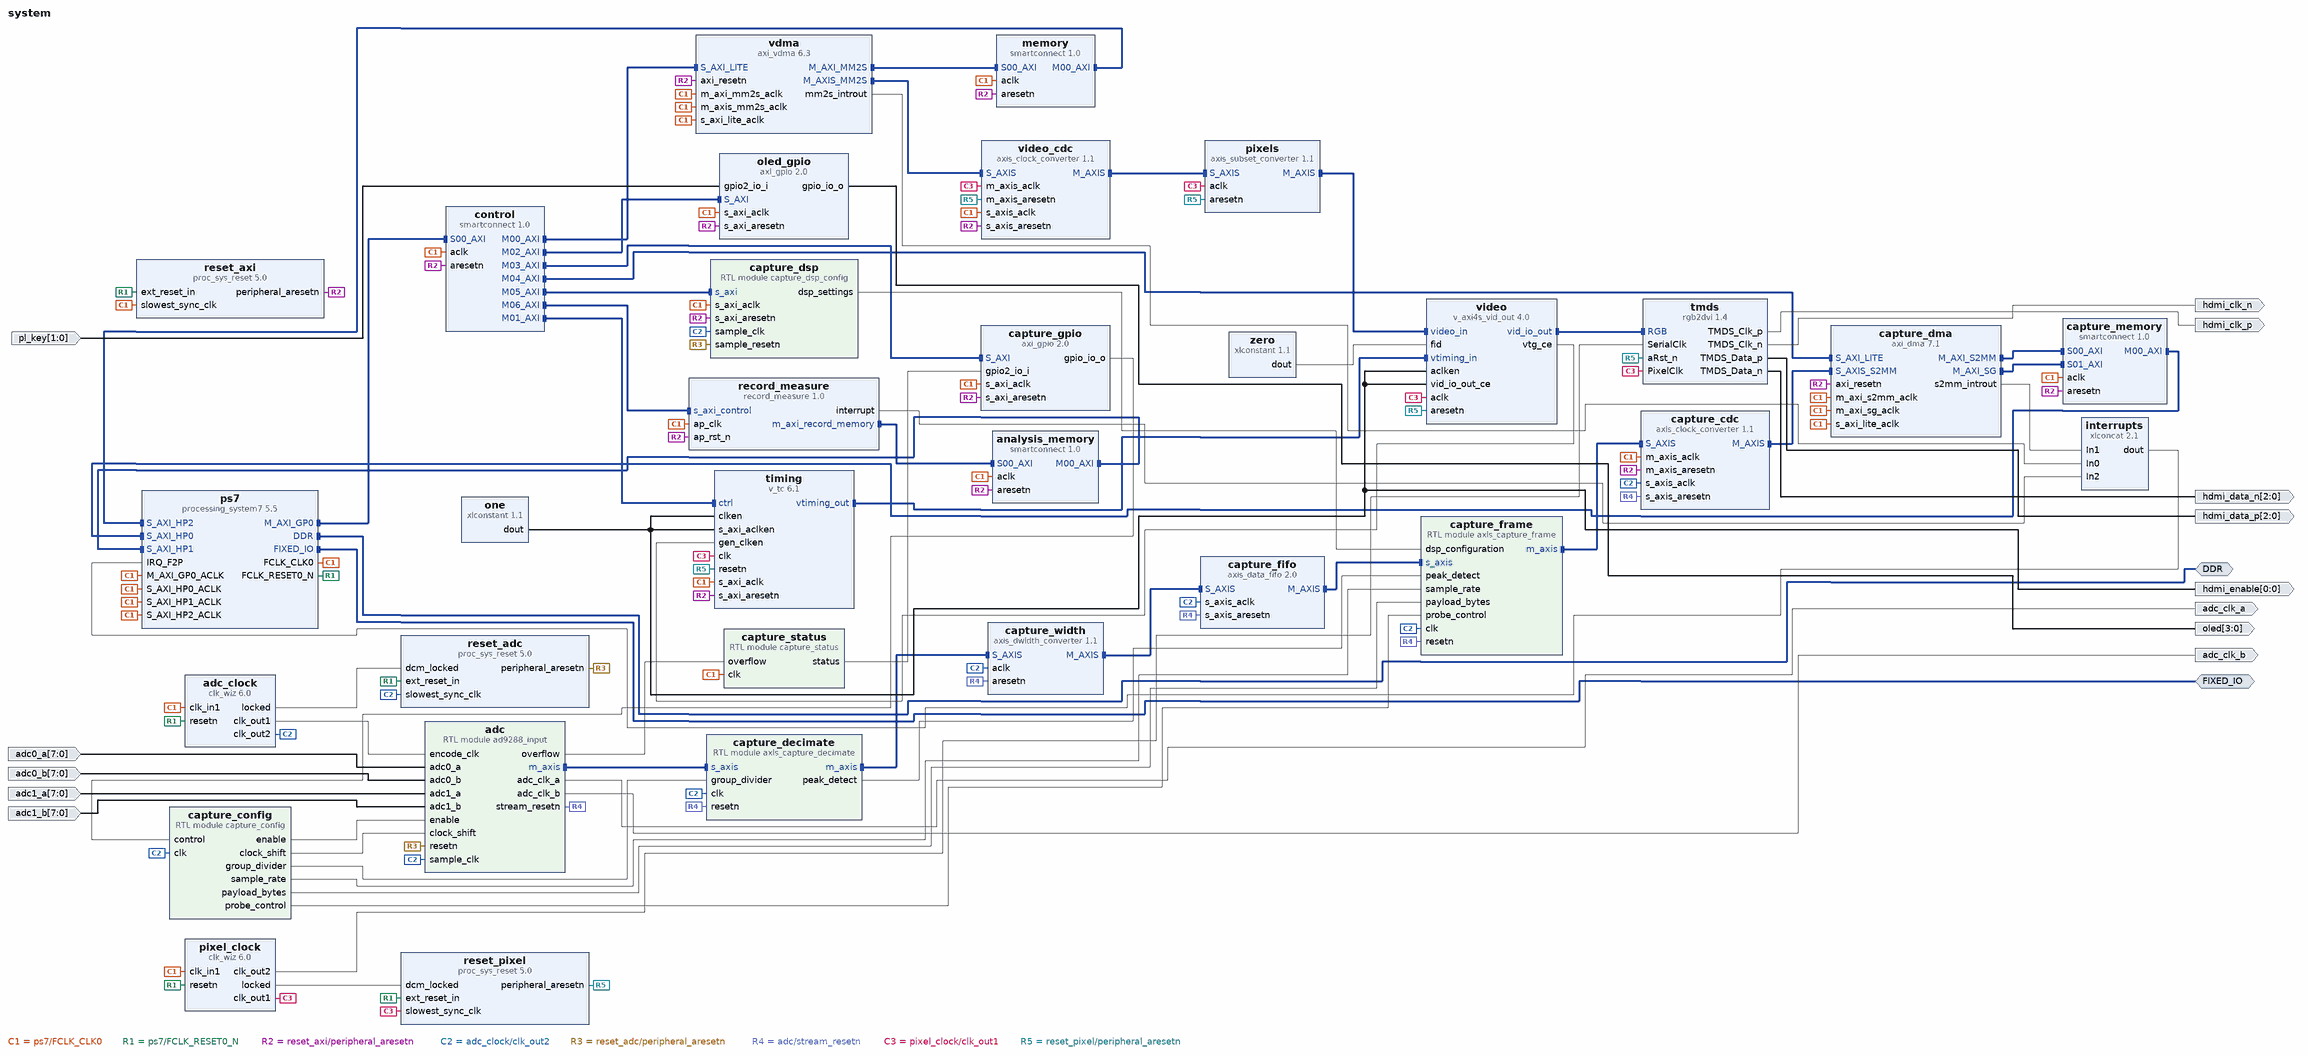
[diagram p0: block diagram of the top level]
# Vivado block design system, xc7z020clg400-1, Vivado 2019.1
create_bd_design system

create_bd_intf_port -mode Master -vlnv xilinx.com:interface:ddrx_rtl:1.0 DDR
create_bd_intf_port -mode Master -vlnv xilinx.com:display_processing_system7:fixedio_rtl:1.0 FIXED_IO
create_bd_port -dir I -from 7 -to 0 adc0_a
create_bd_port -dir I -from 7 -to 0 adc0_b
create_bd_port -dir I -from 7 -to 0 adc1_a
create_bd_port -dir I -from 7 -to 0 adc1_b
create_bd_port -dir O adc_clk_a
create_bd_port -dir O adc_clk_b
create_bd_port -dir O hdmi_clk_p
create_bd_port -dir O hdmi_clk_n
create_bd_port -dir O -from 2 -to 0 hdmi_data_p
create_bd_port -dir O -from 2 -to 0 hdmi_data_n
create_bd_port -dir O -from 0 -to 0 hdmi_enable
create_bd_port -dir O -from 3 -to 0 oled
create_bd_port -dir I -from 1 -to 0 pl_key

create_bd_cell -type ip -vlnv xilinx.com:ip:processing_system7:5.5 ps7
set_property -dict [list \
  CONFIG.PCW_APU_PERIPHERAL_FREQMHZ 600 \
  CONFIG.PCW_FPGA0_PERIPHERAL_FREQMHZ 100 \
  CONFIG.PCW_GPIO_MIO_GPIO_ENABLE 1 \
  CONFIG.PCW_GPIO_MIO_GPIO_IO MIO \
  CONFIG.PCW_I2C_RESET_ENABLE 1 \
  CONFIG.PCW_IRQ_F2P_INTR 1 \
  CONFIG.PCW_PRESET_BANK1_VOLTAGE {LVCMOS 1.8V} \
  CONFIG.PCW_QSPI_GRP_SINGLE_SS_ENABLE 1 \
  CONFIG.PCW_QSPI_GRP_SINGLE_SS_IO {MIO 1 .. 6} \
  CONFIG.PCW_QSPI_PERIPHERAL_ENABLE 1 \
  CONFIG.PCW_QSPI_QSPI_IO {MIO 1 .. 6} \
  CONFIG.PCW_SD0_GRP_CD_ENABLE 0 \
  CONFIG.PCW_SD0_GRP_WP_ENABLE 0 \
  CONFIG.PCW_SD0_PERIPHERAL_ENABLE 1 \
  CONFIG.PCW_SD0_SD0_IO {MIO 40 .. 45} \
  CONFIG.PCW_SD1_PERIPHERAL_ENABLE 1 \
  CONFIG.PCW_SD1_SD1_IO {MIO 10 .. 15} \
  CONFIG.PCW_SDIO_PERIPHERAL_FREQMHZ 100 \
  CONFIG.PCW_SINGLE_QSPI_DATA_MODE x4 \
  CONFIG.PCW_UART1_BAUD_RATE 1000000 \
  CONFIG.PCW_UART1_PERIPHERAL_ENABLE 1 \
  CONFIG.PCW_UART1_UART1_IO {MIO 48 .. 49} \
  CONFIG.PCW_UART_PERIPHERAL_FREQMHZ 100 \
  CONFIG.PCW_UIPARAM_DDR_BUS_WIDTH {16 Bit} \
  CONFIG.PCW_UIPARAM_DDR_FREQ_MHZ 400 \
  CONFIG.PCW_UIPARAM_DDR_PARTNO {MT41J256M16 RE-125} \
  CONFIG.PCW_USB0_PERIPHERAL_ENABLE 1 \
  CONFIG.PCW_USB0_RESET_ENABLE 1 \
  CONFIG.PCW_USB0_RESET_IO {MIO 46} \
  CONFIG.PCW_USB0_USB0_IO {MIO 28 .. 39} \
  CONFIG.PCW_USB_RESET_ENABLE 1 \
  CONFIG.PCW_USB_RESET_SELECT {Share reset pin} \
  CONFIG.PCW_USE_FABRIC_INTERRUPT 1 \
  CONFIG.PCW_USE_S_AXI_HP0 1 \
  CONFIG.PCW_USE_S_AXI_HP1 1 \
  CONFIG.PCW_USE_S_AXI_HP2 1 \
] [get_bd_cells ps7]
# 213 more settings of ps7 are not shown: defaults, MIO pin electricals, DDR timing, and values the tool derives
create_bd_cell -type ip -vlnv xilinx.com:ip:smartconnect:1.0 control
set_property -dict {CONFIG.NUM_MI 7 CONFIG.NUM_SI 1} [get_bd_cells control]
create_bd_cell -type ip -vlnv xilinx.com:ip:axi_gpio:2.0 oled_gpio
set_property -dict [list \
  CONFIG.C_ALL_INPUTS_2 1 \
  CONFIG.C_ALL_OUTPUTS 1 \
  CONFIG.C_DOUT_DEFAULT 0x00000008 \
  CONFIG.C_GPIO2_WIDTH 2 \
  CONFIG.C_GPIO_WIDTH 4 \
  CONFIG.C_IS_DUAL 1 \
] [get_bd_cells oled_gpio]
create_bd_cell -type ip -vlnv xilinx.com:ip:smartconnect:1.0 memory
set_property -dict {CONFIG.NUM_MI 1 CONFIG.NUM_SI 1} [get_bd_cells memory]
create_bd_cell -type ip -vlnv xilinx.com:ip:proc_sys_reset:5.0 reset_axi
create_bd_cell -type ip -vlnv xilinx.com:ip:proc_sys_reset:5.0 reset_pixel
create_bd_cell -type ip -vlnv xilinx.com:ip:clk_wiz:6.0 pixel_clock
set_property -dict [list \
  CONFIG.CLKOUT1_REQUESTED_OUT_FREQ 50 \
  CONFIG.CLKOUT2_REQUESTED_OUT_FREQ 250 \
  CONFIG.CLKOUT2_USED true \
  CONFIG.NUM_OUT_CLKS 2 \
  CONFIG.PRIM_IN_FREQ 100 \
  CONFIG.RESET_TYPE ACTIVE_LOW \
] [get_bd_cells pixel_clock]
create_bd_cell -type ip -vlnv xilinx.com:ip:axi_vdma:6.3 vdma
set_property -dict [list \
  CONFIG.c_include_mm2s 1 \
  CONFIG.c_include_mm2s_dre 0 \
  CONFIG.c_include_s2mm 0 \
  CONFIG.c_m_axi_mm2s_data_width 64 \
  CONFIG.c_m_axis_mm2s_tdata_width 32 \
  CONFIG.c_mm2s_genlock_mode 0 \
  CONFIG.c_mm2s_linebuffer_depth 8192 \
  CONFIG.c_num_fstores 1 \
] [get_bd_cells vdma]
create_bd_cell -type ip -vlnv xilinx.com:ip:axis_clock_converter:1.1 video_cdc
set_property -dict [list \
  CONFIG.HAS_TLAST 1 \
  CONFIG.IS_ACLK_ASYNC 1 \
  CONFIG.TDATA_NUM_BYTES 4 \
  CONFIG.TUSER_WIDTH 1 \
] [get_bd_cells video_cdc]
create_bd_cell -type ip -vlnv xilinx.com:ip:axis_subset_converter:1.1 pixels
set_property -dict [list \
  CONFIG.M_HAS_TLAST 1 \
  CONFIG.M_TDATA_NUM_BYTES 3 \
  CONFIG.M_TUSER_WIDTH 1 \
  CONFIG.S_HAS_TLAST 1 \
  CONFIG.S_TDATA_NUM_BYTES 4 \
  CONFIG.S_TUSER_WIDTH 1 \
  CONFIG.TDATA_REMAP {tdata[23:16],tdata[7:0],tdata[15:8]} \
] [get_bd_cells pixels]
create_bd_cell -type ip -vlnv xilinx.com:ip:v_axi4s_vid_out:4.0 video
create_bd_cell -type ip -vlnv xilinx.com:ip:v_tc:6.1 timing
set_property -dict [list \
  CONFIG.GEN_HSYNC_POLARITY Low \
  CONFIG.GEN_VSYNC_POLARITY Low \
  CONFIG.enable_detection false \
  CONFIG.enable_generation true \
] [get_bd_cells timing]
create_bd_cell -type ip -vlnv digilentinc.com:ip:rgb2dvi:1.4 tmds
set_property -dict {CONFIG.kGenerateSerialClk false CONFIG.kRstActiveHigh false} [get_bd_cells tmds]
create_bd_cell -type ip -vlnv xilinx.com:ip:xlconstant:1.1 one
set_property -dict {CONFIG.CONST_VAL 1 CONFIG.CONST_WIDTH 1} [get_bd_cells one]
create_bd_cell -type ip -vlnv xilinx.com:ip:xlconstant:1.1 zero
set_property -dict {CONFIG.CONST_VAL 0 CONFIG.CONST_WIDTH 1} [get_bd_cells zero]
create_bd_cell -type ip -vlnv xilinx.com:ip:xlconcat:2.1 interrupts
set_property -dict {CONFIG.NUM_PORTS 3} [get_bd_cells interrupts]
create_bd_cell -type ip -vlnv xilinx.com:ip:clk_wiz:6.0 adc_clock
set_property -dict [list \
  CONFIG.CLKOUT1_REQUESTED_OUT_FREQ 100 \
  CONFIG.CLKOUT2_REQUESTED_OUT_FREQ 100 \
  CONFIG.CLKOUT2_REQUESTED_PHASE 148.5 \
  CONFIG.CLKOUT2_USED true \
  CONFIG.NUM_OUT_CLKS 2 \
  CONFIG.PRIM_IN_FREQ 100 \
  CONFIG.RESET_TYPE ACTIVE_LOW \
] [get_bd_cells adc_clock]
create_bd_cell -type ip -vlnv xilinx.com:ip:proc_sys_reset:5.0 reset_adc
create_bd_cell -type ip -vlnv xilinx.com:ip:axi_gpio:2.0 capture_gpio
set_property -dict [list \
  CONFIG.C_ALL_INPUTS_2 1 \
  CONFIG.C_ALL_OUTPUTS 1 \
  CONFIG.C_DOUT_DEFAULT 0x00003000 \
  CONFIG.C_GPIO2_WIDTH 32 \
  CONFIG.C_GPIO_WIDTH 32 \
  CONFIG.C_IS_DUAL 1 \
] [get_bd_cells capture_gpio]
create_bd_cell -type module -reference capture_config capture_config
create_bd_cell -type module -reference capture_dsp_config capture_dsp
create_bd_cell -type module -reference axis_capture_decimate capture_decimate
create_bd_cell -type module -reference ad9288_input adc
create_bd_cell -type module -reference axis_capture_frame capture_frame
create_bd_cell -type module -reference capture_status capture_status
set_property -dict {CONFIG.HAS_ANALYSIS 1 CONFIG.HAS_FILTER 1} [get_bd_cells capture_status]
create_bd_cell -type ip -vlnv xilinx.com:ip:axis_dwidth_converter:1.1 capture_width
set_property -dict {CONFIG.M_TDATA_NUM_BYTES 8 CONFIG.S_TDATA_NUM_BYTES 4} [get_bd_cells capture_width]
create_bd_cell -type ip -vlnv xilinx.com:ip:axis_data_fifo:2.0 capture_fifo
set_property -dict [list \
  CONFIG.FIFO_DEPTH 2048 \
  CONFIG.FIFO_MODE 1 \
  CONFIG.HAS_TLAST 0 \
  CONFIG.TDATA_NUM_BYTES 8 \
] [get_bd_cells capture_fifo]
create_bd_cell -type ip -vlnv xilinx.com:ip:axis_clock_converter:1.1 capture_cdc
set_property -dict [list \
  CONFIG.HAS_TKEEP 1 \
  CONFIG.HAS_TLAST 1 \
  CONFIG.IS_ACLK_ASYNC 1 \
  CONFIG.TDATA_NUM_BYTES 8 \
] [get_bd_cells capture_cdc]
create_bd_cell -type ip -vlnv xilinx.com:ip:axi_dma:7.1 capture_dma
set_property -dict [list \
  CONFIG.c_include_mm2s 0 \
  CONFIG.c_include_s2mm 1 \
  CONFIG.c_include_s2mm_dre 0 \
  CONFIG.c_include_sg 1 \
  CONFIG.c_m_axi_s2mm_data_width 64 \
  CONFIG.c_s2mm_burst_size 64 \
  CONFIG.c_sg_include_stscntrl_strm 0 \
  CONFIG.c_sg_length_width 23 \
] [get_bd_cells capture_dma]
create_bd_cell -type ip -vlnv xilinx.com:ip:smartconnect:1.0 capture_memory
set_property -dict {CONFIG.NUM_MI 1 CONFIG.NUM_SI 2} [get_bd_cells capture_memory]
create_bd_cell -type ip -vlnv xilinx.com:hls:record_measure:1.0 record_measure
create_bd_cell -type ip -vlnv xilinx.com:ip:smartconnect:1.0 analysis_memory
set_property -dict {CONFIG.NUM_MI 1 CONFIG.NUM_SI 1} [get_bd_cells analysis_memory]

# ---- connections ----

connect_bd_intf_net [get_bd_intf_ports DDR] [get_bd_intf_pins ps7/DDR]
connect_bd_intf_net [get_bd_intf_ports FIXED_IO] [get_bd_intf_pins ps7/FIXED_IO]
connect_bd_intf_net [get_bd_intf_pins control/M04_AXI] [get_bd_intf_pins capture_dma/S_AXI_LITE]
connect_bd_intf_net [get_bd_intf_pins capture_dma/M_AXI_S2MM] [get_bd_intf_pins capture_memory/S00_AXI]
connect_bd_intf_net [get_bd_intf_pins capture_memory/M00_AXI] [get_bd_intf_pins ps7/S_AXI_HP0]
connect_bd_intf_net [get_bd_intf_pins capture_frame/m_axis] [get_bd_intf_pins capture_cdc/S_AXIS]
connect_bd_intf_net [get_bd_intf_pins control/M03_AXI] [get_bd_intf_pins capture_gpio/S_AXI]
connect_bd_intf_net [get_bd_intf_pins capture_cdc/M_AXIS] [get_bd_intf_pins capture_dma/S_AXIS_S2MM]
connect_bd_intf_net [get_bd_intf_pins capture_width/M_AXIS] [get_bd_intf_pins capture_fifo/S_AXIS]
connect_bd_intf_net [get_bd_intf_pins capture_decimate/m_axis] [get_bd_intf_pins capture_width/S_AXIS]
connect_bd_intf_net [get_bd_intf_pins capture_dma/M_AXI_SG] [get_bd_intf_pins capture_memory/S01_AXI]
connect_bd_intf_net [get_bd_intf_pins adc/m_axis] [get_bd_intf_pins capture_decimate/s_axis]
connect_bd_intf_net [get_bd_intf_pins capture_fifo/M_AXIS] [get_bd_intf_pins capture_frame/s_axis]
connect_bd_intf_net [get_bd_intf_pins control/M05_AXI] [get_bd_intf_pins capture_dsp/s_axi]
connect_bd_intf_net [get_bd_intf_pins record_measure/m_axi_record_memory] [get_bd_intf_pins analysis_memory/S00_AXI]
connect_bd_intf_net [get_bd_intf_pins analysis_memory/M00_AXI] [get_bd_intf_pins ps7/S_AXI_HP1]
connect_bd_intf_net [get_bd_intf_pins control/M06_AXI] [get_bd_intf_pins record_measure/s_axi_control]
connect_bd_intf_net [get_bd_intf_pins control/M01_AXI] [get_bd_intf_pins timing/ctrl]
connect_bd_intf_net [get_bd_intf_pins memory/M00_AXI] [get_bd_intf_pins ps7/S_AXI_HP2]
connect_bd_intf_net [get_bd_intf_pins control/M02_AXI] [get_bd_intf_pins oled_gpio/S_AXI]
connect_bd_intf_net [get_bd_intf_pins video_cdc/M_AXIS] [get_bd_intf_pins pixels/S_AXIS]
connect_bd_intf_net [get_bd_intf_pins vdma/M_AXI_MM2S] [get_bd_intf_pins memory/S00_AXI]
connect_bd_intf_net [get_bd_intf_pins video/vid_io_out] [get_bd_intf_pins tmds/RGB]
connect_bd_intf_net [get_bd_intf_pins ps7/M_AXI_GP0] [get_bd_intf_pins control/S00_AXI]
connect_bd_intf_net [get_bd_intf_pins pixels/M_AXIS] [get_bd_intf_pins video/video_in]
connect_bd_intf_net [get_bd_intf_pins timing/vtiming_out] [get_bd_intf_pins video/vtiming_in]
connect_bd_intf_net [get_bd_intf_pins control/M00_AXI] [get_bd_intf_pins vdma/S_AXI_LITE]
connect_bd_intf_net [get_bd_intf_pins vdma/M_AXIS_MM2S] [get_bd_intf_pins video_cdc/S_AXIS]
connect_bd_net [get_bd_pins ps7/FCLK_CLK0] \
  [get_bd_pins adc_clock/clk_in1] [get_bd_pins ps7/S_AXI_HP0_ACLK] [get_bd_pins capture_memory/aclk] \
  [get_bd_pins capture_dma/s_axi_lite_aclk] [get_bd_pins capture_dma/m_axi_s2mm_aclk] [get_bd_pins capture_dma/m_axi_sg_aclk] \
  [get_bd_pins capture_cdc/m_axis_aclk] [get_bd_pins capture_gpio/s_axi_aclk] [get_bd_pins capture_status/clk] \
  [get_bd_pins capture_dsp/s_axi_aclk] [get_bd_pins ps7/S_AXI_HP1_ACLK] [get_bd_pins record_measure/ap_clk] \
  [get_bd_pins analysis_memory/aclk] [get_bd_pins ps7/M_AXI_GP0_ACLK] [get_bd_pins ps7/S_AXI_HP2_ACLK] \
  [get_bd_pins control/aclk] [get_bd_pins memory/aclk] [get_bd_pins reset_axi/slowest_sync_clk] \
  [get_bd_pins pixel_clock/clk_in1] [get_bd_pins vdma/s_axi_lite_aclk] [get_bd_pins vdma/m_axi_mm2s_aclk] \
  [get_bd_pins vdma/m_axis_mm2s_aclk] [get_bd_pins video_cdc/s_axis_aclk] [get_bd_pins timing/s_axi_aclk] \
  [get_bd_pins oled_gpio/s_axi_aclk]
connect_bd_net [get_bd_pins ps7/FCLK_RESET0_N] \
  [get_bd_pins adc_clock/resetn] [get_bd_pins reset_adc/ext_reset_in] [get_bd_pins reset_axi/ext_reset_in] \
  [get_bd_pins reset_pixel/ext_reset_in] [get_bd_pins pixel_clock/resetn]
connect_bd_net [get_bd_pins reset_axi/peripheral_aresetn] \
  [get_bd_pins capture_memory/aresetn] [get_bd_pins capture_dma/axi_resetn] [get_bd_pins capture_cdc/m_axis_aresetn] \
  [get_bd_pins capture_gpio/s_axi_aresetn] [get_bd_pins capture_dsp/s_axi_aresetn] [get_bd_pins record_measure/ap_rst_n] \
  [get_bd_pins analysis_memory/aresetn] [get_bd_pins control/aresetn] [get_bd_pins memory/aresetn] \
  [get_bd_pins vdma/axi_resetn] [get_bd_pins video_cdc/s_axis_aresetn] [get_bd_pins timing/s_axi_aresetn] \
  [get_bd_pins oled_gpio/s_axi_aresetn]
connect_bd_net [get_bd_pins adc_clock/clk_out1] [get_bd_pins adc/encode_clk]
connect_bd_net [get_bd_pins adc_clock/clk_out2] \
  [get_bd_pins adc/sample_clk] [get_bd_pins reset_adc/slowest_sync_clk] [get_bd_pins capture_config/clk] \
  [get_bd_pins capture_decimate/clk] [get_bd_pins capture_width/aclk] [get_bd_pins capture_fifo/s_axis_aclk] \
  [get_bd_pins capture_frame/clk] [get_bd_pins capture_cdc/s_axis_aclk] [get_bd_pins capture_dsp/sample_clk]
connect_bd_net [get_bd_pins adc_clock/locked] [get_bd_pins reset_adc/dcm_locked]
connect_bd_net [get_bd_pins reset_adc/peripheral_aresetn] [get_bd_pins adc/resetn] [get_bd_pins capture_dsp/sample_resetn]
connect_bd_net [get_bd_pins capture_gpio/gpio_io_o] [get_bd_pins capture_config/control]
connect_bd_net [get_bd_pins capture_config/enable] [get_bd_pins adc/enable]
connect_bd_net [get_bd_pins capture_config/clock_shift] [get_bd_pins adc/clock_shift]
connect_bd_net [get_bd_pins capture_decimate/peak_detect] [get_bd_pins capture_frame/peak_detect]
connect_bd_net [get_bd_pins capture_config/group_divider] [get_bd_pins capture_decimate/group_divider]
connect_bd_net [get_bd_pins capture_config/sample_rate] [get_bd_pins capture_frame/sample_rate]
connect_bd_net [get_bd_pins capture_config/payload_bytes] [get_bd_pins capture_frame/payload_bytes]
connect_bd_net [get_bd_pins capture_config/probe_control] [get_bd_pins capture_frame/probe_control]
connect_bd_net [get_bd_pins capture_dsp/dsp_settings] [get_bd_pins capture_frame/dsp_configuration]
connect_bd_net [get_bd_pins adc/stream_resetn] \
  [get_bd_pins capture_decimate/resetn] [get_bd_pins capture_width/aresetn] [get_bd_pins capture_fifo/s_axis_aresetn] \
  [get_bd_pins capture_frame/resetn] [get_bd_pins capture_cdc/s_axis_aresetn]
connect_bd_net [get_bd_pins adc/overflow] [get_bd_pins capture_status/overflow]
connect_bd_net [get_bd_pins capture_status/status] [get_bd_pins capture_gpio/gpio2_io_i]
connect_bd_net [get_bd_pins capture_dma/s2mm_introut] [get_bd_pins interrupts/In1]
connect_bd_net [get_bd_ports adc0_a] [get_bd_pins adc/adc0_a]
connect_bd_net [get_bd_ports adc0_b] [get_bd_pins adc/adc0_b]
connect_bd_net [get_bd_ports adc1_a] [get_bd_pins adc/adc1_a]
connect_bd_net [get_bd_ports adc1_b] [get_bd_pins adc/adc1_b]
connect_bd_net [get_bd_pins adc/adc_clk_a] [get_bd_ports adc_clk_a]
connect_bd_net [get_bd_pins adc/adc_clk_b] [get_bd_ports adc_clk_b]
connect_bd_net [get_bd_pins record_measure/interrupt] [get_bd_pins interrupts/In2]
connect_bd_net [get_bd_pins pixel_clock/clk_out1] \
  [get_bd_pins reset_pixel/slowest_sync_clk] [get_bd_pins video_cdc/m_axis_aclk] [get_bd_pins pixels/aclk] \
  [get_bd_pins video/aclk] [get_bd_pins timing/clk] [get_bd_pins tmds/PixelClk]
connect_bd_net [get_bd_pins pixel_clock/clk_out2] [get_bd_pins tmds/SerialClk]
connect_bd_net [get_bd_pins pixel_clock/locked] [get_bd_pins reset_pixel/dcm_locked]
connect_bd_net [get_bd_pins reset_pixel/peripheral_aresetn] \
  [get_bd_pins video_cdc/m_axis_aresetn] [get_bd_pins pixels/aresetn] [get_bd_pins video/aresetn] [get_bd_pins timing/resetn] \
  [get_bd_pins tmds/aRst_n]
connect_bd_net [get_bd_pins zero/dout] [get_bd_pins video/fid]
connect_bd_net [get_bd_pins one/dout] \
  [get_bd_pins video/aclken] [get_bd_pins video/vid_io_out_ce] [get_bd_pins timing/clken] [get_bd_pins timing/s_axi_aclken] \
  [get_bd_ports hdmi_enable]
connect_bd_net [get_bd_pins video/vtg_ce] [get_bd_pins timing/gen_clken]
connect_bd_net [get_bd_pins vdma/mm2s_introut] [get_bd_pins interrupts/In0]
connect_bd_net [get_bd_pins interrupts/dout] [get_bd_pins ps7/IRQ_F2P]
connect_bd_net [get_bd_pins tmds/TMDS_Clk_p] [get_bd_ports hdmi_clk_p]
connect_bd_net [get_bd_pins tmds/TMDS_Clk_n] [get_bd_ports hdmi_clk_n]
connect_bd_net [get_bd_pins tmds/TMDS_Data_p] [get_bd_ports hdmi_data_p]
connect_bd_net [get_bd_pins tmds/TMDS_Data_n] [get_bd_ports hdmi_data_n]
connect_bd_net [get_bd_pins oled_gpio/gpio_io_o] [get_bd_ports oled]
connect_bd_net [get_bd_ports pl_key] [get_bd_pins oled_gpio/gpio2_io_i]

# ---- address map ----
assign_bd_address -offset 0x00000000 -range 512M -target_address_space [get_bd_addr_spaces capture_dma/Data_S2MM] [get_bd_addr_segs ps7/S_AXI_HP0/HP0_DDR_LOWOCM]
assign_bd_address -offset 0x00000000 -range 512M -target_address_space [get_bd_addr_spaces capture_dma/Data_SG] [get_bd_addr_segs ps7/S_AXI_HP0/HP0_DDR_LOWOCM]
assign_bd_address -offset 0x40400000 -range 64K -target_address_space [get_bd_addr_spaces ps7/Data] [get_bd_addr_segs capture_dma/S_AXI_LITE/Reg]
assign_bd_address -offset 0x41200000 -range 64K -target_address_space [get_bd_addr_spaces ps7/Data] [get_bd_addr_segs oled_gpio/S_AXI/Reg]
assign_bd_address -offset 0x41210000 -range 64K -target_address_space [get_bd_addr_spaces ps7/Data] [get_bd_addr_segs capture_gpio/S_AXI/Reg]
assign_bd_address -offset 0x41220000 -range 64K -target_address_space [get_bd_addr_spaces ps7/Data] [get_bd_addr_segs capture_dsp/s_axi/reg0]
assign_bd_address -offset 0x43000000 -range 64K -target_address_space [get_bd_addr_spaces ps7/Data] [get_bd_addr_segs vdma/S_AXI_LITE/Reg]
assign_bd_address -offset 0x43C00000 -range 64K -target_address_space [get_bd_addr_spaces ps7/Data] [get_bd_addr_segs timing/ctrl/Reg]
assign_bd_address -offset 0x43C20000 -range 64K -target_address_space [get_bd_addr_spaces ps7/Data] [get_bd_addr_segs record_measure/s_axi_control/Reg]
assign_bd_address -offset 0x00000000 -range 512M -target_address_space [get_bd_addr_spaces record_measure/Data_m_axi_record_memory] [get_bd_addr_segs ps7/S_AXI_HP1/HP1_DDR_LOWOCM]
assign_bd_address -offset 0x00000000 -range 512M -target_address_space [get_bd_addr_spaces vdma/Data_MM2S] [get_bd_addr_segs ps7/S_AXI_HP2/HP2_DDR_LOWOCM]

validate_bd_design
save_bd_design
